# Altium schematic sheet Lamps_motherboard.SchDoc
size A4
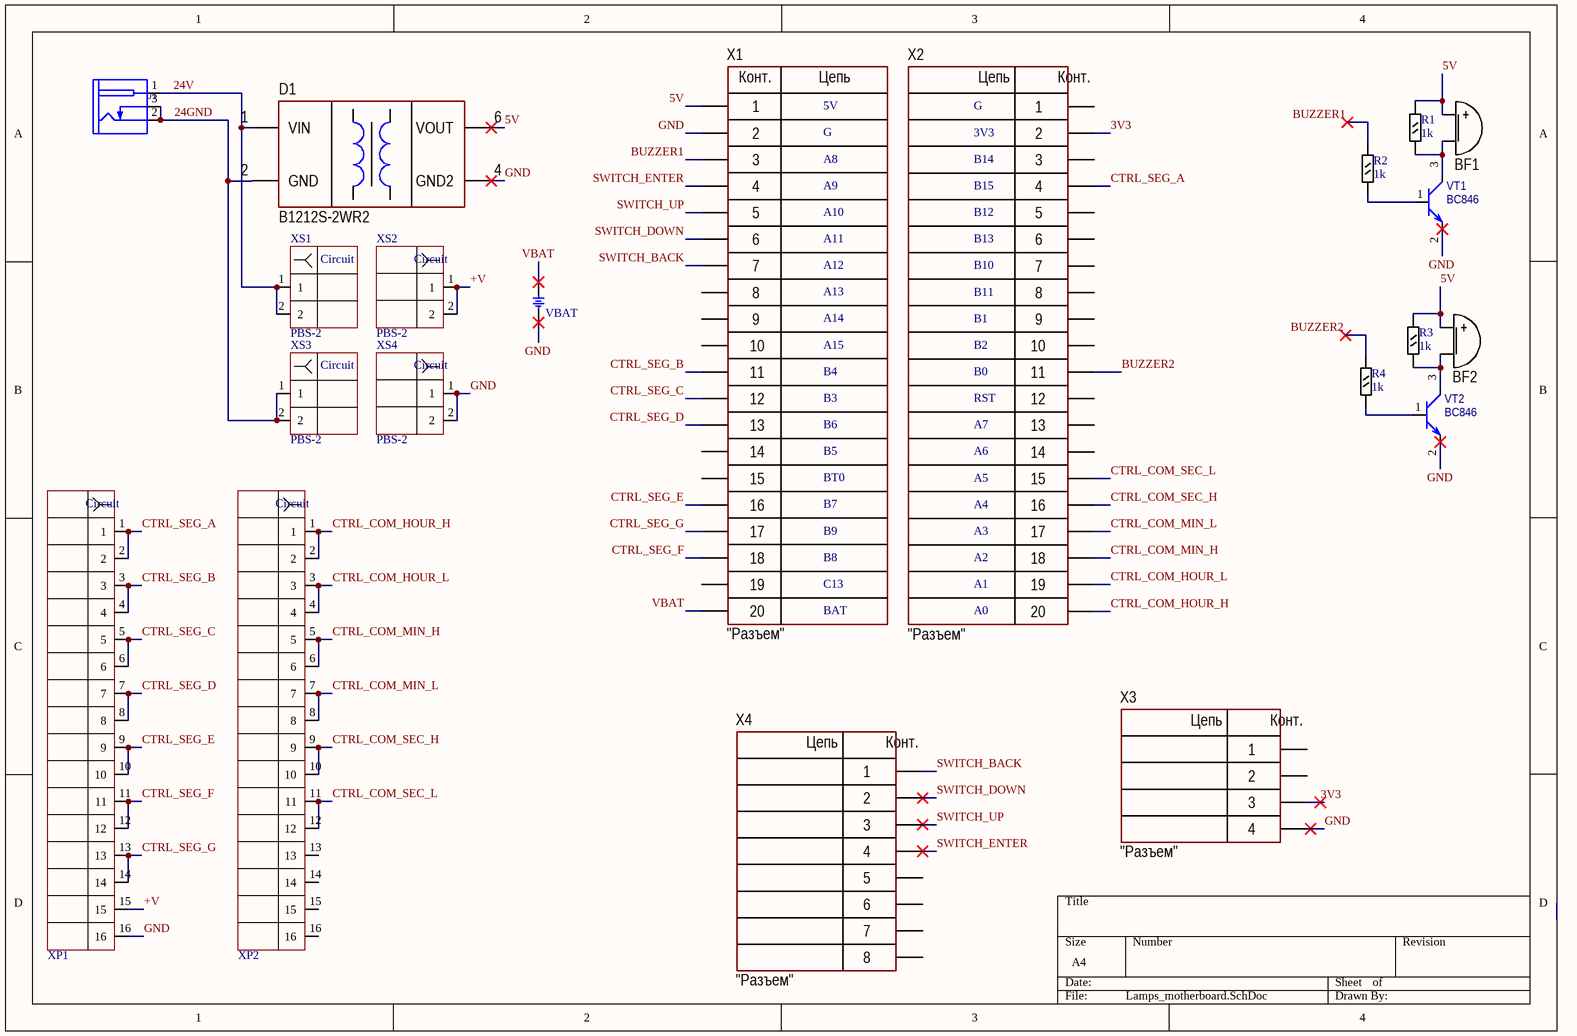
[diagram p0: Lamps_motherboard.SchDoc]

## Parts
BF1  (no value)  [BUZ: AT-0927-TT-6-R]
BF2  (no value)  [BUZ: AT-0927-TT-6-R]
BT1  VBAT  [BTH2032]
D1  (no value)  [MOD: SIP-7 (B1212S-2W)]
J1  DC_POWER_JACK  [JAC_PWR2MM]  (value not drawn)
R1  1k  [RESC2012(0805)N]
R2  1k  [RESC2012(0805)N]
R3  1k  [RESC2012(0805)N]
R4  1k  [RESC2012(0805)N]
VT1  BC846  [SOT23-3N]
VT2  BC846  [SOT23-3N]
X1  CommentText: "Разъем"  [CON: PBD-20]
X2  CommentText: "Разъем"  [CON: PBD-20]
X3  CommentText: "Разъем"  [HDRR_F_2X2]
X4  CommentText: "Разъем"  [HDRR_F_2X4]
XP1  PBD-16  [HDR2X8]  (value not drawn)
XP2  PBD-16  [HDR2X8]  (value not drawn)
XS1  PBS-2  [PBS-2-3D]
XS2  PBS-2  [PBS-2-3D]
XS3  PBS-2  [PBS-2-3D]
XS4  PBS-2  [PBS-2-3D]

## Nets
3V3: X2.2 X3.3
5V: BF1.1(+) BF2.1(+) D1.6(VOUT) R1.1 R3.1 X1.1
24GND: D1.2(GND) J1.2(SLEEVE) J1.3(INSERTION_DET) XS3.1 XS3.2
24V: D1.1(VIN) J1.1(TIP) XS1.1 XS1.2
+V: XP1.15 XS2.1 XS2.2
BUZZER1: R2.2 X1.3
BUZZER2: R4.2 X2.11
CTRL_COM_HOUR_H: X2.20 XP2.1 XP2.2
CTRL_COM_HOUR_L: X2.19 XP2.3 XP2.4
CTRL_COM_MIN_H: X2.18 XP2.5 XP2.6
CTRL_COM_MIN_L: X2.17 XP2.7 XP2.8
CTRL_COM_SEC_H: X2.16 XP2.9 XP2.10
CTRL_COM_SEC_L: X2.15 XP2.11 XP2.12
CTRL_SEG_A: X2.4 XP1.1 XP1.2
CTRL_SEG_B: X1.11 XP1.3 XP1.4
CTRL_SEG_C: X1.12 XP1.5 XP1.6
CTRL_SEG_D: X1.13 XP1.7 XP1.8
CTRL_SEG_E: X1.16 XP1.9 XP1.10
CTRL_SEG_F: X1.18 XP1.11 XP1.12
CTRL_SEG_G: X1.17 XP1.13 XP1.14
GND: BT1.2 D1.4(GND2) VT1.2(E) VT2.2(E) X1.2 X3.4 XP1.16 XS4.1 XS4.2
SWITCH_BACK: X1.7 X4.1
SWITCH_DOWN: X1.6 X4.2
SWITCH_ENTER: X1.4 X4.4
SWITCH_UP: X1.5 X4.3
VBAT: BT1.1 X1.20
NetBF1_2: BF1.2(-) R1.2 VT1.3(C)
NetBF2_2: BF2.2(-) R3.2 VT2.3(C)
NetR2_1: R2.1 VT1.1(B)
NetR4_1: R4.1 VT2.1(B)

Not connected (* = marked no-connect by the designer): X1 8 9 10 14 15 19; X2 1 3 5 6 7 8 9 10 12 13 14; X3 1 2; X4 5 6 7 8; XP2 13 14 15 16

## Notes on the sheet
- 5V
- G
- A8
- 3V3
- B14
- A9
- A10
- A11
- B15
- B12
- B13
- A12
- A13
- B10
- B11
- A14
- A15
- B4
- B1
- B2
- B0
- B3
- B6
- RST
- A7
- B5
- BT0
- B7
- A6
- A5
- A4
- B9
- B8
- C13
- A3
- A2
- A1
- BAT
- A0
- (in symbol PBD-4) Цепь; Конт.
- (in symbol PBD-8) Цепь; Конт.
- (in symbol PBD-20) Цепь; Конт.
- (in symbol PBS-2) Circuit
- (in symbol SH2-16G) Circuit

## Library data of the parts
BF1 BF2 = Buzzer: Manufacturer: PUI Audio; ValueManufacturerPartNumber: DIP switch, 2.73 kHz, 3VDC, 80mA, -20...+70°C; PartNumber: AT-0927-TT-6-R; TypeBuzzer: DIP switch; VoltageMax: 3VDC; Frequency: 2.73 kHz; CurrentMax: 80mA; HelpURL: https://www.digikey.com/products/en?keywords=AT-0927-TT-6-R; Temperature: -20...+70°C
BT1 = BATH_CR2032: BATTERY HOLDER, CR2032; VALUE: BAT3volt; MANF_P#: -
D1 = B1212S-2WR2: DC/DC converter; Manufacturer: Mornsun; ValueManufacturerPartNumber: DC/DC converter, isolator, 12V 167mA, -40...+105°C, SIP-7; OutputType: isolator; OutputVoltage: 12V 167mA; HelpURL: https://www.compel.ru/infosheet/MORNSUN/B1212S-2WR2; Package: SIP-7; ComponentType: DC/DC converter; Temperature: -40...+105°C; PartNumber: B1212S-2WR2
J1 = CONN_PWR_JACK2MM: CONN, PWR JACK DC, PLUG DIAM 2.0MM RA THD; MANF: CUI STACK; MANF_P#: PJ-202A, PJ-002AH, PJ-102AH, KLDX-0202; VALUE: DC_POWER_JACK
R1-R4 = RESC2012(0805): Part Number: RESC2012(0805); Package: 0805
VT1 VT2 = BC848: Part Number: BC848; HelpURL: http://www.nxp.com/documents/data_sheet/BC848_SER.pdf
X1 X2 = PBD-20: Manufacturer: Connfly; ValueManufacturerPartNumber: Connector, 20pin, 2.54mm, 500VAC, 3A; TypeConnector: Connector; VoltageMax: 500VAC; Pitch: 2.54mm; CurrentMax: 3A; Multichannel: 20pin; HelpURL: https://www.chipdip.ru/product/pbd-20; PartNumber: PBD-20; System: Connector
X3 = PBD-4: Manufacturer: Connfly; ValueManufacturerPartNumber: Connector, 4pin, 2.54mm, 500VAC, 3A; TypeConnector: Connector; VoltageMax: 500VAC; Pitch: 2.54mm; CurrentMax: 3A; Multichannel: 4pin; HelpURL: https://www.chipdip.ru/product/pbd-4; PartNumber: PBD-4; System: Connector
X4 = PBD-8: Manufacturer: Connfly; ValueManufacturerPartNumber: Connector, 8pin, 2.54mm, 500VAC, 3A; TypeConnector: Connector; VoltageMax: 500VAC; Pitch: 2.54mm; CurrentMax: 3A; Multichannel: 8pin; HelpURL: https://www.chipdip.ru/product/pbd-8; PartNumber: PBD-8; System: Connector
XP1 = SH2-16G: CONN RCPT 16POS 0.1 GOLD PCB; System:Connector: True; System: Connector; Part Number: SH2-16G; Manufacturer Part Number: SH2-16G; Digi-Key Part Number: ED3071-ND; Price$: 0.20250; Package: Socket 16POS 2.54mm; HelpURL: https://www.digikey.com/en/products/detail/on-shore-technology-inc/SH2-16G/2721215
XP2 = SH2-16G: CONN RCPT 16POS 0.1 GOLD PCB; System: Connector; Part Number: SH2-16G; Manufacturer Part Number: SH2-16G; Digi-Key Part Number: ED3071-ND; Price$: 0.20250; Package: Socket 16POS 2.54mm; HelpURL: https://www.digikey.com/en/products/detail/on-shore-technology-inc/SH2-16G/2721215
XS1-XS4 = PBS-2: Part Number: PBS-2